# Altium schematic sheet main sch.SchDoc
size A4; SheetNumber: 1; SheetTotal: 4
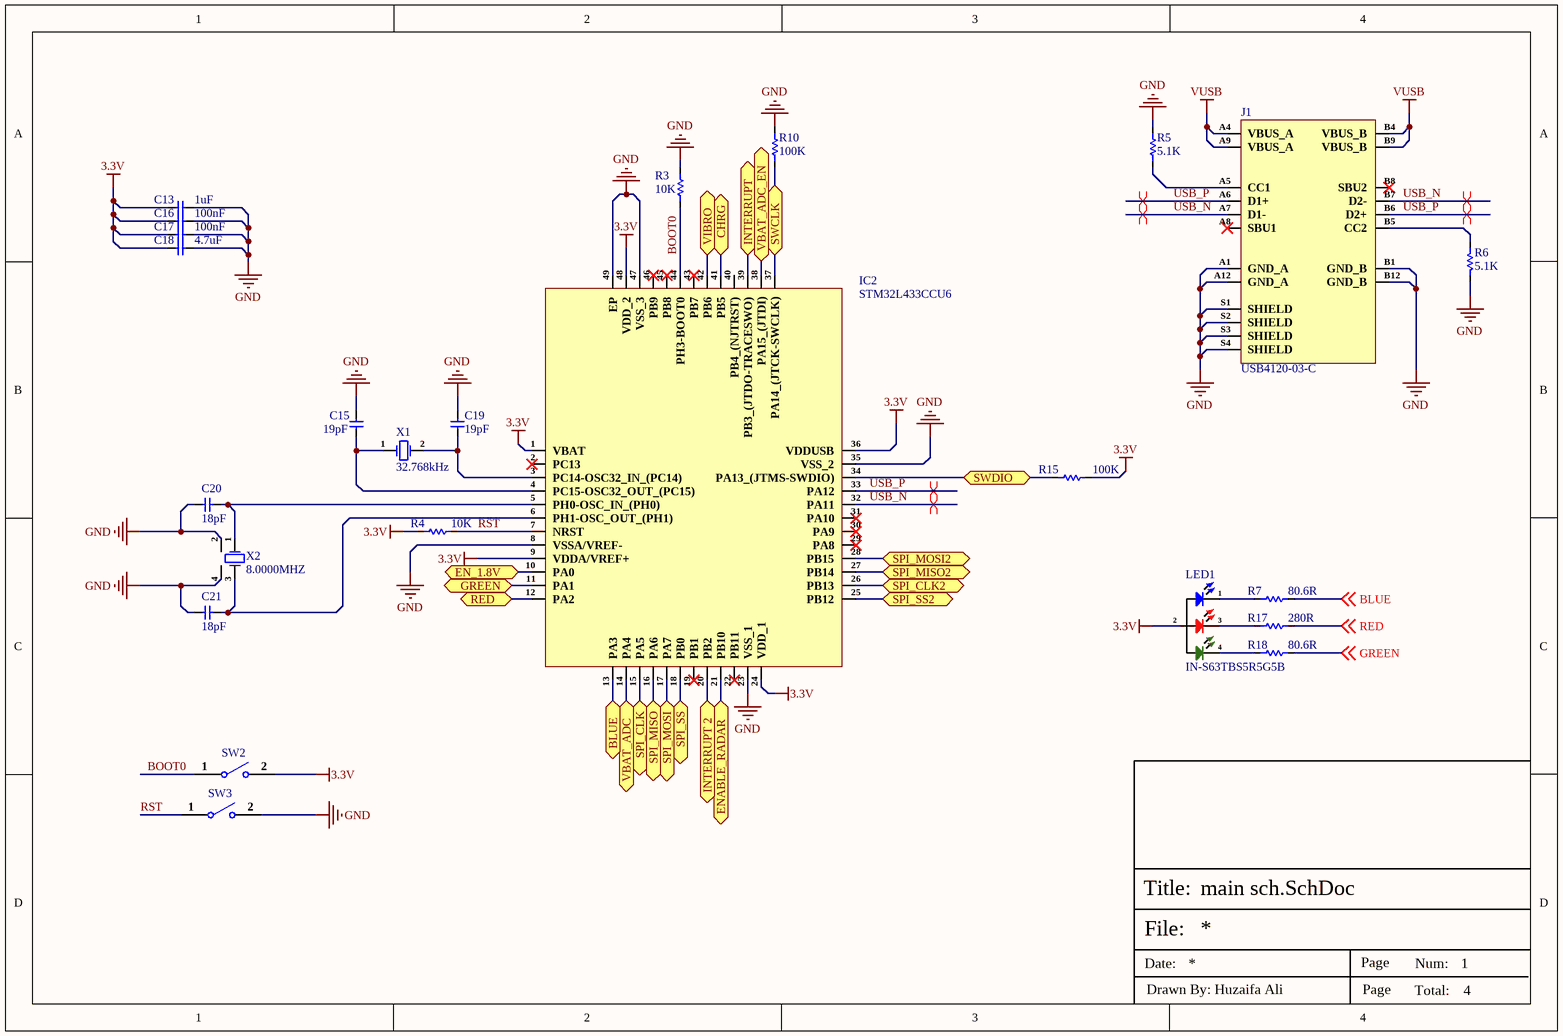
[diagram p0: main sch.SchDoc]

## Parts
C13  1uF  [Cap-0402]
C15  19pF  [Cap-0402]
C16  100nF  [Cap-0402]
C17  100nF  [Cap-0402]
C18  4.7uF  [Cap-0402]
C19  19pF  [Cap-0402]
C20  18pF  [CAP-0201]
C21  18pF  [CAP-0201]
IC2  STM32L433CCU6  [48-UFQFPN(7x7)]
J1  USB4120-03-C  [USB4120-03-C]
LED1  IN-S63TBS5R5G5B  [IN-S63TBS5R5G5B]
R3  10K  [Res-0402]
R4  10K  [Res-0402]
R5  5.1K  [Res-0402]
R6  5.1K  [Res-0402]
R7  80.6R  [Res-0402]
R10  100K  [Res-0402]
R15  100K  [Res-0402]
R17  280R  [Res-0402]
R18  80.6R  [Res-0402]
SW2  B3U-1000P  [B3U-1000P]  (value not drawn)
SW3  B3U-1000P  [B3U-1000P]  (value not drawn)
X1  32.768kHz  [SMD1610-2P]
X2  8.0000MHZ  [SMD3225-4P]

## Ports
BLUE (bidir), CHRG (bidir), EN_1.8V (bidir), ENABLE_RADAR (bidir), GREEN (bidir), INTERRUPT 2 (bidir), INTERRUPT (bidir), RED (bidir), SPI_CLK2 (bidir), SPI_CLK (bidir), SPI_MISO2 (bidir), SPI_MISO (bidir), SPI_MOSI2 (bidir), SPI_MOSI (bidir), SPI_SS2 (bidir), SPI_SS (bidir), SWCLK (bidir), SWDIO (bidir), VBAT_ADC (bidir), VBAT_ADC_EN (bidir), VIBRO (bidir)

## Nets
3.3V: C13.1 C16.1 C17.1 C18.1 IC2.1(VBAT) IC2.9(VDDA/VREF+) IC2.24(VDD_1) IC2.36(VDDUSB) IC2.48(VDD_2) LED1.2(+) R4.1 R15.1 SW2.2
GND: C13.2 C15.2 C16.2 C17.2 C18.2 C19.2 C20.1 C21.1 IC2.8(VSSA/VREF-) IC2.23(VSS_1) IC2.35(VSS_2) IC2.47(VSS_3) IC2.49(EP) J1.A1(GND_A) J1.A12(GND_A) J1.B1(GND_B) J1.B12(GND_B) J1.S1(SHIELD) J1.S2(SHIELD) J1.S3(SHIELD) J1.S4(SHIELD) R3.2 R5.2 R6.1 R10.2 SW3.2 X2.2(GND) X2.4(GND)
VUSB: J1.A4(VBUS_A) J1.A9(VBUS_A) J1.B4(VBUS_B) J1.B9(VBUS_B)
BLUE: IC2.13(PA3) ; port BLUE
BLUE: R7.2 ; off-sheet BLUE  [a separate net that carries the same name]
BOOT0: IC2.44(PH3-BOOT0) R3.1 SW2.1
CHRG: IC2.41(PB5) ; port CHRG
EN_1.8V: IC2.10(PA0) ; port EN_1.8V
ENABLE_RADAR: IC2.21(PB10) ; port ENABLE_RADAR
GREEN: IC2.11(PA1) ; port GREEN
GREEN: R18.2 ; off-sheet GREEN  [a separate net that carries the same name]
INTERRUPT: IC2.39(PB3_(JTDO-TRACESWO)) ; port INTERRUPT
INTERRUPT 2: IC2.20(PB2) ; port INTERRUPT 2
RED: IC2.12(PA2) ; port RED
RED: R17.2 ; off-sheet RED  [a separate net that carries the same name]
RST: IC2.7(NRST) R4.2 SW3.1
SPI_CLK: IC2.15(PA5) ; port SPI_CLK
SPI_CLK2: IC2.26(PB13) ; port SPI_CLK2
SPI_MISO: IC2.16(PA6) ; port SPI_MISO
SPI_MISO2: IC2.27(PB14) ; port SPI_MISO2
SPI_MOSI: IC2.17(PA7) ; port SPI_MOSI
SPI_MOSI2: IC2.28(PB15) ; port SPI_MOSI2
SPI_SS: IC2.18(PB0) ; port SPI_SS
SPI_SS2: IC2.25(PB12) ; port SPI_SS2
SWCLK: IC2.37(PA14_(JTCK-SWCLK)) R10.1 ; port SWCLK
SWDIO: IC2.34(PA13_(JTMS-SWDIO)) R15.2 ; port SWDIO
USB_N: IC2.32(PA11) J1.A7(D1-) J1.B7(D2-)
USB_P: IC2.33(PA12) J1.A6(D1+) J1.B6(D2+)
VBAT_ADC: IC2.14(PA4) ; port VBAT_ADC
VBAT_ADC_EN: IC2.38(PA15_(JTDI)) ; port VBAT_ADC_EN
VIBRO: IC2.42(PB6) ; port VIBRO
NetC15_1: C15.1 IC2.4(PC15-OSC32_OUT_(PC15)) X1.1(OSC1)
NetC19_1: C19.1 IC2.3(PC14-OSC32_IN_(PC14)) X1.2(OSC2)
NetC20_2: C20.2 IC2.5(PH0-OSC_IN_(PH0)) X2.1(IN/OUT)
NetC21_2: C21.2 IC2.6(PH1-OSC_OUT_(PH1)) X2.3(Out/In)
NetJ1_A5: J1.A5(CC1) R5.1
NetJ1_B5: J1.B5(CC2) R6.2
NetLED1_1: LED1.1(-BLUE) R7.1
NetLED1_3: LED1.3(-RED) R17.1
NetLED1_4: LED1.4(-GREEN) R18.1

Not connected (* = marked no-connect by the designer): IC2 2(PC13)* 19(PB1)* 22(PB11)* 29(PA8)* 30(PA9)* 31(PA10)* 40(PB4_(NJTRST)) 43(PB7)* 45(PB8)* 46(PB9)*; J1 A8(SBU1)* B8(SBU2)*

## Layout directives
differential pair; net class USB; differential pair class USB_Lines; rule Impedance Constraint [Min = 88.00    Max = 90.00    ]; rule Matched Net Lengths [Tolerance = 20mil]: USB_N, USB_P

## Notes on the sheet
- File:
- Title:
- Date:
- Page
- Num:
- Total:
- Drawn By: Huzaifa Ali

## Library data of the parts
C13 = CC0402KRX5R7BB105: CAP CER 1UF 16V X5R 0402; Manufacturer: Yageo; Tolerance: 10%; Item Type: Capacitor; Supplier 1: Digi-Key; Manufacturer Part Number: CC0402KRX5R7BB105; Stock 1: 1405667; Pricing 1: 1=0.36, 10=0.252, 100=0.1512, 500=0.1134, 1000=0.09576, 2500=0.09072, 5000=0.08568 (USD); Mount: Surface Mount; Case/Package: 0402; Weight: 2.3E-05oz; Case Code (Imperial): 0402; Case Code (Metric): 1005; Min Operating Temperature: -55°C; Max Operating Temperature: 85°C; Capacitance: 1uF; Dielectric: X5R; Packaging: Tape and Reel; Voltage Rating (DC): 16V; Voltage Rating: 16V; Termination: SMD/SMT; Composition: Ceramic; Length: 1mm; Height: 0.5mm; Width: 0.02inch; Thickness: 0.022inch; Depth: 0.5mm; Radiation Hardening: No; Lead Free: Lead Free; Halogen Free: Halogen Free; ComponentLink1URL: http://www.yageo.com/documents/recent/UPY-GPHC_X5R_4V-to-50V_12.pdf?src-supplier=Avnet+Europe; ComponentLink1Description: http://www.yageo.com/documents/recent/UPY-GPHC_X5R_4V-to-50V_12.pdf?src-supplier=Avnet+Europe; Supplier Part Number 1: 311-1691-6-ND; LCSC Part Number: C325464
C15 C19 = GJM1555C1H190GB01D: CAP CER 19PF 50V C0G/NP0 0402; Manufacturer: Murata; Item Type: Ceramic Capacitors; Supplier: Mouser; Supplier Part Number: 81-GJM1555C1H190GB1D; Manufacturer Part Number: GJM1555C1H190GB01D; RoHS: Yes; Stock: 2045; Pricing: 1=0.13, 10=0.082, 50=0.082, 100=0.042, 1000=0.027, 10000=0.02 (USD)
C16 C17 = CC0402KRX5R7BB104: CAP CER 0.1UF 16V X5R 0402; Manufacturer: Yageo; Tolerance: 10%; Supplier 1: Mouser; Manufacturer Part Number: CC0402KRX5R7BB104; RoHS: Yes; Category: Ceramic Capacitors; Stock 1: 936792; Pricing 1: 1=0.10000, 10=0.02300, 50=0.02300, 100=0.01100, 1000=0.00600, 10000=0.00400 (USD); Mount: Surface Mount; Case/Package: 0402; Number of Pins: 2; Case Code (Metric): 1005; Case Code (Imperial): 0402; Min Operating Temperature: -55°C; Max Operating Temperature: 85°C; Capacitance: 100nF; Dielectric: X5R; Packaging: Tape and Reel; Voltage Rating: 16V; Package Quantity: 1; Voltage Rating (DC): 16V; Termination: SMD/SMT; Resistor Type: Ceramic; Series: CC; Construction: Flat; Length: 1mm; Width: 0.02inch; Height: 0.5mm; Thickness: 0.022inch; Depth: 0.5mm; Radiation Hardening: No; REACH SVHC: Unknown; Lead Free: Lead Free; Halogen Free: Halogen Free; RoHS Compliant: Yes; ComponentLink1URL: https://datasheet.ciiva.com/155/mlccorderingcode-155879.pdf?src-supplier=Digi-Key; ComponentLink1Description: https://datasheet.ciiva.com/155/mlccorderingcode-155879.pdf?src-supplier=Digi-Key; ComponentLink2URL: https://datasheet.ciiva.com/155/mlccorderingcode-155878.pdf?src-supplier=Digi-Key; ComponentLink2Description: https://datasheet.ciiva.com/155/mlccorderingcode-155878.pdf?src-supplier=Digi-Key; ComponentLink3URL: https://datasheet.ciiva.com/155/mlccorderingcode-155880.pdf?src-supplier=Digi-Key; ComponentLink3Description: https://datasheet.ciiva.com/155/mlccorderingcode-155880.pdf?src-supplier=Digi-Key; ComponentLink4URL: https://datasheet.ciiva.com/11464/upy-gphc-x5r-4v-to-50v-12-11464869.pdf?src-supplier=Avnet; ComponentLink4Description: https://datasheet.ciiva.com/11464/upy-gphc-x5r-4v-to-50v-12-11464869.pdf?src-supplier=Avnet; Supplier Part Number 1: 603-CC402KRX5R7BB104; LCSC Part Number: C106204
C18 = CC0402KRX5R6BB475: CAP CER 4.7UF 10V X5R 0402; Manufacturer: Yageo; Tolerance: 10%; Supplier 1: Farnell; Manufacturer Part Number: CC0402KRX5R6BB475; RoHS: Yes; Category: Ceramic Capacitors; Stock 1: 20000; Pricing 1: 10000=0.02310, 50000=0.02100 (GBP); Mount: Surface Mount; Case/Package: 0402; Case Code (Imperial): 0402; Case Code (Metric): 1005; Min Operating Temperature: -55°C; Max Operating Temperature: 85°C; Packaging: Cut Tape; Capacitance: 4.7uF; Voltage Rating: 10V; RoHS Compliant: Yes; ComponentLink1URL: http://www.yageo.com/documents/recent/UPY-GPHC_X5R_4V-to-50V_25.pdf?src-supplier=Digi-Key; ComponentLink1Description: http://www.yageo.com/documents/recent/UPY-GPHC_X5R_4V-to-50V_25.pdf?src-supplier=Digi-Key; Supplier Part Number 1: 3871698; LCSC Part Number: C326586
C20 C21 = GJM0335C1E180GB01D: CAP CER 18PF 25V C0G/NP0 0201; Manufacturer: Murata Electronics; Item Type: Capacitor; Manufacturer Part Number: GJM0335C1E180GB01D; Package: 0201; LCSC Part Number: C913481; ComponentLink1Description: LCSC; Supplier: Rs; Supplier Part Number: 1853317; RoHS: Yes; Category: Ceramic Capacitors; Stock: 15000; Pricing: 1000=0.018, 5000=0.015, 10000=0.012 (GBP); ComponentLink2URL: http://www.mouser.com/ds/2/281/c02e-2905.pdf?src-supplier=Mouser; ComponentLink2Description: http://www.mouser.com/ds/2/281/c02e-2905.pdf?src-supplier=Mouser; ComponentLink3URL: https://datasheet.octopart.com/GJM0335C1E180GB01D-Murata-datasheet-22122223.pdf?src-supplier=Future+Electronics; ComponentLink3Description: https://datasheet.octopart.com/GJM0335C1E180GB01D-Murata-datasheet-22122223.pdf?src-supplier=Future+Electronics; ComponentLink4URL: https://search.murata.co.jp/Ceramy/image/img/A01X/G101/ENG/GJM0335C1E180GB01-01.pdf?src-supplier=Digi-Key; ComponentLink4Description: https://search.murata.co.jp/Ceramy/image/img/A01X/G101/ENG/GJM0335C1E180GB01-01.pdf?src-supplier=Digi-Key; ComponentLink5URL: http://search.murata.co.jp/Ceramy/image/img/A01X/G101/ENG/GJM0335C1E180GB01-01.pdf?src-supplier=Digi-Key; ComponentLink5Description: http://search.murata.co.jp/Ceramy/image/img/A01X/G101/ENG/GJM0335C1E180GB01-01.pdf?src-supplier=Digi-Key; ComponentLink6URL: https://datasheet.octopart.com/GJM0335C1E180GB01D-Murata-datasheet-12511495.pdf?src-supplier=TME; ComponentLink6Description: https://datasheet.octopart.com/GJM0335C1E180GB01D-Murata-datasheet-12511495.pdf?src-supplier=TME
IC2 = STM32L433CCU6: IC MCU 32BIT 256KB FLSH 48UFQFPN; Manufacturer: STMicroelectronics; Datasheet Link: http://www.st.com/content/ccc/resource/technical/document/datasheet/f7/a0/fc/27/24/4e/4f/3f/DM00257192.pdf/files/DM00257192.pdf/jcr:content/translations/en.DM00257192.pdf; Height: 0.6mm; Manufacturer Part Number: STM32L433CCU6; Mouser Part Number: 511-STM32L433CCU6; Mouser Price/Stock: https://www.mouser.co.uk/ProductDetail/STMicroelectronics/STM32L433CCU6?qs=dTJS0cRn7oiKq9T6SJeUpg%3D%3D; Arrow Part Number: STM32L433CCU6; Arrow Price/Stock: https://www.arrow.com/en/products/stm32l433ccu6/stmicroelectronics?region=nac; LCSC Part Number: C1341450; Item Type: IC
J1 = USB4120-03-C: CONN RCPT USB2.0 TYP C 24POS SMD; Manufacturer: Global Connector Technology; Item Type: Connector; Supplier: Future Electronics; Supplier Part Number: 2142143; Manufacturer Part Number: USB4120-03-C; RoHS: No; Category: Connectors; Stock: 600; Pricing: 600=0.545, 1200=0.53, 1800=0.525, 2400=0.52, 3000=0.5 (USD); ComponentLink1URL: https://datasheet.octopart.com/USB4120-03-C-Global-Connector-Technology-datasheet-169246750.pdf?src-supplier=Future+Electronics; ComponentLink1Description: https://datasheet.octopart.com/USB4120-03-C-Global-Connector-Technology-datasheet-169246750.pdf?src-supplier=Future+Electronics; ComponentLink2URL: https://datasheet.octopart.com/USB4120-03-C-GCT-datasheet-166929325.pdf?src-supplier=TME; ComponentLink2Description: https://datasheet.octopart.com/USB4120-03-C-GCT-datasheet-166929325.pdf?src-supplier=TME
LED1 = IN-S63TBS5R5G5B: LED RGB CLEAR 0603 SMD R/A; Manufacturer: Inolux; Supplier: Mouser; Supplier Part Number: 743-IN-S63TBS5R5G5B; Manufacturer Part Number: IN-S63TBS5R5G5B; RoHS: No; Category: LEDs; Stock: 12751; Pricing: 1=0.5, 10=0.328, 50=0.328, 100=0.218, 1000=0.152, 10000=0.141 (USD); Item Type: LED
R3 R4 = RC0402FR-0710KL: RES 10K OHM 1% 1/16W 0402; Manufacturer: Yageo; Resistance: 10kR; Voltage Rating (DC): 50V; Temperature Coefficient: 100ppm/°C; Power Rating: 62.5mW; Max Power Dissipation: 63mW; Item Type: Resistor; Supplier 1: Mouser; Manufacturer Part Number: RC0402FR-0710KL; RoHS: Yes; Category: Chip SMD Resistors; Stock 1: 18648329; Pricing 1: 1=0.10000, 10=0.01400, 50=0.01400, 100=0.00500, 1000=0.00300, 10000=0.00200 (USD); Case/Package: 0402; Number of Pins: 2; Case Code (Imperial): 0402; Case Code (Metric): 1005; Min Operating Temperature: -55°C; Max Operating Temperature: 155°C; Resistor Type: Thick Film; Tolerance: 1%; Packaging: Tape and Reel; Voltage Rating: 50V; Termination: SMD/SMT; Working Voltage: 50V; Number of Terminations: 2; Features: Moisture Resistant; Series: RC; Resistance Tolerance: 1%; Construction: Rectangular; Length: 1mm; Width: 0.5mm; Height: 0.32mm; Depth: 0.5mm; Lead Pitch: 0.2mm; REACH SVHC: No SVHC; Lead Free: Lead Free; RoHS Compliant: Yes; Military Standard: Not; ComponentLink1URL: https://datasheet.ciiva.com/7660/38568-7660787.pdf?src-supplier=Element14; ComponentLink1Description: https://datasheet.ciiva.com/7660/38568-7660787.pdf?src-supplier=Element14; ComponentLink2URL: https://datasheet.ciiva.com/7849/1686128-7849814.pdf?src-supplier=Element14; ComponentLink2Description: https://datasheet.ciiva.com/7849/1686128-7849814.pdf?src-supplier=Element14; ComponentLink3URL: https://datasheet.ciiva.com/7983/1018594-7983486.pdf?src-supplier=Element14; ComponentLink3Description: https://datasheet.ciiva.com/7983/1018594-7983486.pdf?src-supplier=Element14; ComponentLink4URL: https://datasheet.ciiva.com/22747/1018594-22747512.pdf?src-supplier=Element14; ComponentLink4Description: https://datasheet.ciiva.com/22747/1018594-22747512.pdf?src-supplier=Element14; ComponentLink5URL: https://datasheet.ciiva.com/12667/pyu-rc0402-51-rohs-l-6-r-12667067.pdf?src-supplier=Mouser; ComponentLink5Description: https://datasheet.ciiva.com/12667/pyu-rc0402-51-rohs-l-6-r-12667067.pdf?src-supplier=Mouser; ComponentLink6URL: https://datasheet.ciiva.com/7849/1784430-7849813.pdf?src-supplier=Element14; ComponentLink6Description: https://datasheet.ciiva.com/7849/1784430-7849813.pdf?src-supplier=Element14; ComponentLink7URL: https://datasheet.ciiva.com/7849/1784430-7849815.pdf?src-supplier=Element14; ComponentLink7Description: https://datasheet.ciiva.com/7849/1784430-7849815.pdf?src-supplier=Element14; Supplier Part Number 1: 603-RC0402FR-0710KL; LCSC Part Number: C60490
R5 R6 = RC0402FR-075K1L: RES 5.1K OHM 1% 1/16W 0402; Manufacturer: Yageo; Power Rating: 63mW; Resistance: 5.1kR; Temperature Coefficient: 100ppm/°C; Voltage Rating: 50V; Item Type: Resistor; Supplier 1: Avnet; Manufacturer Part Number: RC0402FR-075K1L; RoHS: Yes; Category: Chip SMD Resistors; Stock 1: 65000; Pricing 1: 10000=0.00085 (USD); Case/Package: 0402; Case Code (Metric): 1005; Case Code (Imperial): 0402; Min Operating Temperature: -55°C; Max Operating Temperature: 155°C; Tolerance: 1%; Technology: THICK FILM; Packaging: Tape and Reel; Package Quantity: 1; Resistor Type: Thick Film; Number of Terminations: 2; Termination: SMD/SMT; Max Power Dissipation: 63mW; Voltage Rating (DC): 50V; Working Voltage: 50V; Features: Moisture Resistant; Series: RC; Resistance Tolerance: 1%; Construction: Rectangular; Length: 1mm; Width: 0.02inch; Height: 0.016inch; Depth: 0.5mm; RoHS Compliant: Yes; Military Standard: Not; Lead Free: Lead Free; ComponentLink1URL: https://datasheet.ciiva.com/7983/1018594-7983519.pdf?src-supplier=Element14; ComponentLink1Description: https://datasheet.ciiva.com/7983/1018594-7983519.pdf?src-supplier=Element14; ComponentLink2URL: https://datasheet.ciiva.com/46394/1018594-46394936.pdf?src-supplier=Element14; ComponentLink2Description: https://datasheet.ciiva.com/46394/1018594-46394936.pdf?src-supplier=Element14; ComponentLink3URL: https://datasheet.ciiva.com/2453/pyu-r-int-thick-7-2453401.pdf?src-supplier=Digi-Key; ComponentLink3Description: https://datasheet.ciiva.com/2453/pyu-r-int-thick-7-2453401.pdf?src-supplier=Digi-Key; ComponentLink4URL: https://datasheet.ciiva.com/2453/pyu-r-int-thick-7-2453402.pdf?src-supplier=Digi-Key; ComponentLink4Description: https://datasheet.ciiva.com/2453/pyu-r-int-thick-7-2453402.pdf?src-supplier=Digi-Key; ComponentLink5URL: https://datasheet.ciiva.com/2453/pyu-r-int-thick-7-2453400.pdf?src-supplier=Digi-Key; ComponentLink5Description: https://datasheet.ciiva.com/2453/pyu-r-int-thick-7-2453400.pdf?src-supplier=Digi-Key; ComponentLink6URL: https://datasheet.ciiva.com/12558/pyu-rc0402-51-rohs-l-6-r-8721-12558460.pdf?src-supplier=Mouser; ComponentLink6Description: https://datasheet.ciiva.com/12558/pyu-rc0402-51-rohs-l-6-r-8721-12558460.pdf?src-supplier=Mouser; ComponentLink7URL: https://datasheet.ciiva.com/16744/pyu-rc0402-51-rohs-l-6-r-16744283.pdf?src-supplier=Future+Electronics; ComponentLink7Description: https://datasheet.ciiva.com/16744/pyu-rc0402-51-rohs-l-6-r-16744283.pdf?src-supplier=Future+Electronics; ComponentLink8URL: https://datasheet.ciiva.com/15189/getdatasheetpartid-323636-15189493.pdf?src-supplier=Verical; ComponentLink8Description: https://datasheet.ciiva.com/15189/getdatasheetpartid-323636-15189493.pdf?src-supplier=Verical; Supplier Part Number 1: RC0402FR-075K1L; LCSC Part Number: C105872
R7 R18 = RN73H1ETTP80R6F50: Res 80.6 Ohm 1% 1/16W 0402; Manufacturer: KOA Speer; Item Type: Resistor; Power Rating: 63mW; Voltage Rating: 50V; Temperature Coefficient: 50ppm/°C; Supplier: Digikey; Supplier Part Number: 2019-RN73H1ETTP80R6F50CT-ND; Manufacturer Part Number: RN73H1ETTP80R6F50; RoHS: Yes; Pricing: 1000=0.08675 (USD); Case/Package: 0402; Case Code (Imperial): 0402; Case Code (Metric): 1005; Weight: 2.3E-05oz; Min Operating Temperature: -55°C; Max Operating Temperature: 155°C; Value: 80.6R; Packaging: Tape and Reel; Tolerance: 1%; Termination: SMD/SMT; Voltage Rating (DC): 50V; Series: RN73H; Length: 1mm; Width: 0.5mm; Height: 0.35mm; RoHS Compliant: Yes; ComponentLink1URL: http://www.mouser.com/ds/2/219/RN73H-12200.pdf?src-supplier=Mouser; ComponentLink1Description: http://www.mouser.com/ds/2/219/RN73H-12200.pdf?src-supplier=Mouser
R10 R15 = RC0402FR-07100KL: RES 100K OHM 1% 1/16W 0402; Manufacturer: Yageo; Resistance: 100kR; Temperature Coefficient: 100ppm/°C; Power Rating: 63mW; Voltage Rating: 50V; Item Type: Resistor; Supplier 1: Mouser; Manufacturer Part Number: RC0402FR-07100KL; RoHS: Yes; Category: Chip SMD Resistors; Stock 1: 7759549; Pricing 1: 1=0.10000, 10=0.01200, 50=0.01200, 100=0.00500, 1000=0.00300, 2500=0.00200, 10000=0.00100 (USD); Case/Package: 0402; Case Code (Metric): 1005; Case Code (Imperial): 0402; Min Operating Temperature: -55°C; Max Operating Temperature: 155°C; Resistor Type: Thick Film; Tolerance: 1%; Packaging: Tape and Reel; Package Quantity: 1; Number of Terminations: 2; Termination: SMD/SMT; Max Power Dissipation: 63mW; Working Voltage: 50V; Features: Moisture Resistant; Series: RC; Resistance Tolerance: 1%; Construction: Rectangular; Technology: THICK FILM; Length: 0.039inch; Width: 0.02inch; Height: 0.016inch; Depth: 0.5mm; REACH SVHC: No SVHC; Lead Free: Lead Free; RoHS Compliant: Yes; Military Standard: Not; ComponentLink1URL: https://datasheet.ciiva.com/11819/0900766b80c66297-11819452.pdf?src-supplier=RSComponents; ComponentLink1Description: https://datasheet.ciiva.com/11819/0900766b80c66297-11819452.pdf?src-supplier=RSComponents; ComponentLink2URL: https://datasheet.ciiva.com/22747/1018594-22747509.pdf?src-supplier=Element14; ComponentLink2Description: https://datasheet.ciiva.com/22747/1018594-22747509.pdf?src-supplier=Element14; ComponentLink3URL: https://datasheet.ciiva.com/2453/pyu-r-int-thick-7-2453362.pdf?src-supplier=Digi-Key; ComponentLink3Description: https://datasheet.ciiva.com/2453/pyu-r-int-thick-7-2453362.pdf?src-supplier=Digi-Key; ComponentLink4URL: https://datasheet.ciiva.com/2453/pyu-r-int-thick-7-2453363.pdf?src-supplier=Digi-Key; ComponentLink4Description: https://datasheet.ciiva.com/2453/pyu-r-int-thick-7-2453363.pdf?src-supplier=Digi-Key; ComponentLink5URL: https://datasheet.ciiva.com/2453/pyu-r-int-thick-7-2453361.pdf?src-supplier=Digi-Key; ComponentLink5Description: https://datasheet.ciiva.com/2453/pyu-r-int-thick-7-2453361.pdf?src-supplier=Digi-Key; ComponentLink6URL: https://datasheet.ciiva.com/12667/pyu-rc0402-51-rohs-l-6-r-12667930.pdf?src-supplier=Mouser; ComponentLink6Description: https://datasheet.ciiva.com/12667/pyu-rc0402-51-rohs-l-6-r-12667930.pdf?src-supplier=Mouser; ComponentLink7URL: https://datasheet.ciiva.com/15189/getdatasheetpartid-323696-15189334.pdf?src-supplier=Verical; ComponentLink7Description: https://datasheet.ciiva.com/15189/getdatasheetpartid-323696-15189334.pdf?src-supplier=Verical; Supplier Part Number 1: 603-RC0402FR-07100KL; LCSC Part Number: C60491
R17 = RN73H1ETTP2800D50: RES 280 OHM 0.5% 1/16W 0402; Manufacturer: KOA Speer; Item Type: Resistor; Power Rating: 63mW; Voltage Rating: 50V; Temperature Coefficient: 50ppm/°C; Supplier: Digikey; Supplier Part Number: 2019-RN73H1ETTP2800D50CT-ND; Manufacturer Part Number: RN73H1ETTP2800D50; RoHS: Yes; Pricing: 1000=0.08675 (USD); Case/Package: 0402; Case Code (Imperial): 0402; Case Code (Metric): 1005; Min Operating Temperature: -55°C; Max Operating Temperature: 155°C; Value: 280R; Packaging: Tape and Reel; Tolerance: 0.5%; Termination: SMD/SMT; Voltage Rating (DC): 50V; Series: RN73H; Length: 1mm; Width: 0.5mm; Height: 0.35mm; RoHS Compliant: Yes; ComponentLink1URL: http://www.koaspeer.com/catimages/Products/RN73H/RN73H.pdf?src-supplier=Mouser; ComponentLink1Description: http://www.koaspeer.com/catimages/Products/RN73H/RN73H.pdf?src-supplier=Mouser
SW2 SW3 = B3U-1000P: SWITCH TACTILE SPST-NO 0.05A 12V; Manufacturer: Omron; Mechanical Life: 200000Cycles; Operating Force: 1.5N; Throw Configuration: SPST; Current Rating: 50mA; Contact Resistance: 100mR; Illumination Type: Non-Illuminated,Illuminated; Switch Travel: 0.15mm; Switch Function: Off-Mom; Actuator Type: Standard; Actuator Length: 0.4mm; Ratings: Dust Proof,IP40; ComponentLink1URL: http://www.farnell.com/datasheets/60838.pdf?src-supplier=Farnell; ComponentLink1Description: http://www.farnell.com/datasheets/60838.pdf?src-supplier=Farnell; ComponentLink2URL: http://www.farnell.com/datasheets/60838.pdf?src-supplier=Element14; ComponentLink2Description: http://www.farnell.com/datasheets/60838.pdf?src-supplier=Element14; ComponentLink3URL: https://omronfs.omron.com/en_US/ecb/products/pdf/en-b3u.pdf?src-supplier=Digi-Key; ComponentLink3Description: https://omronfs.omron.com/en_US/ecb/products/pdf/en-b3u.pdf?src-supplier=Digi-Key; ComponentLink4URL: http://www.omron.com/ecb/products/pdf/en-b3u.pdf?src-supplier=Digi-Key; ComponentLink4Description: http://www.omron.com/ecb/products/pdf/en-b3u.pdf?src-supplier=Digi-Key; ComponentLink5URL: https://www.distrelec.biz/Web/Downloads/he/et/B3U_eng_datasheet.pdf?mime=application%2Fpdf&src-supplier=Distrelec; ComponentLink5Description: https://www.distrelec.biz/Web/Downloads/he/et/B3U_eng_datasheet.pdf?mime=application%2Fpdf&src-supplier=Distrelec; ComponentLink6URL: http://www.onlinecomponents.com/productFiles/mf-OM/en-b3u.pdf?src-supplier=Onlinecomponents.com; ComponentLink6Description: http://www.onlinecomponents.com/productFiles/mf-OM/en-b3u.pdf?src-supplier=Onlinecomponents.com; Supplier 1: Digi-Key; Manufacturer Part Number: B3U-1000P; Stock 1: 116454; Pricing 1: 1=1, 10=0.961, 25=0.9064, 50=0.7976, 100=0.7251, 250=0.68888, 500=0.67074, 1000=0.52571 (USD); Mount: Surface Mount; Weight: 0.000776oz; Contact Material: Silver; Min Operating Temperature: -25°C; Max Operating Temperature: 70°C; Packaging: Tape and Reel; Voltage Rating (DC): 12V; Package Quantity: 1; Max Current Rating: 50mA; Termination: SMD/SMT; Orientation: Straight; Max Voltage Rating (DC): 12V; Electrical Life: 200000Cycles; Insulation Resistance: 100MR; Contact Current Rating: 50mA; Length: 4mm; Height: 1.2mm; Depth: 2.5mm; Width: 3mm; REACH SVHC: Unknown; Lead Free: Lead Free; ComponentLink7URL: https://www.verical.com/server-webapp/html/getDatasheet?partID=552554&src-supplier=Verical; ComponentLink7Description: https://www.verical.com/server-webapp/html/getDatasheet?partID=552554&src-supplier=Verical; ComponentLink8URL: http://www.farnell.com/datasheets/1685550.pdf?src-supplier=Element14; ComponentLink8Description: http://www.farnell.com/datasheets/1685550.pdf?src-supplier=Element14; ComponentLink9URL: http://www.farnell.com/datasheets/2610940.pdf?src-supplier=Farnell; ComponentLink9Description: http://www.farnell.com/datasheets/2610940.pdf?src-supplier=Farnell; ComponentLink10URL: https://www.alliedelec.com/m/d/4c8a9ef82804fc3c241a13c1e298fd73.pdf?src-supplier=Allied+Electronics; ComponentLink10Description: https://www.alliedelec.com/m/d/4c8a9ef82804fc3c241a13c1e298fd73.pdf?src-supplier=Allied+Electronics; Supplier Part Number 1: SW1020DKR-ND; LCSC Part Number: C231329; Item Type: Switch
X1 = ECS-.327-12.5-16-TR: CRYSTAL 32.7680KHZ 12.5PF SMD; Manufacturer: ECS International; Supplier: Avnet; Supplier Part Number: ECS-.327-12.5-16-TR; Manufacturer Part Number: ECS-.327-12.5-16-TR; RoHS: Yes; Category: Crystals; Stock: 20000; Pricing: 5000=0.403 (USD); ComponentLink1URL: https://datasheet.octopart.com/ECS-.327-12.5-16-TR-ECS-International-datasheet-14433430.pdf?src-supplier=Future+Electronics; ComponentLink1Description: https://datasheet.octopart.com/ECS-.327-12.5-16-TR-ECS-International-datasheet-14433430.pdf?src-supplier=Future+Electronics; ComponentLink2URL: http://www.ecsxtal.com/store/pdf/ECX-16.pdf?src-supplier=Digikey; ComponentLink2Description: http://www.ecsxtal.com/store/pdf/ECX-16.pdf?src-supplier=Digikey; ComponentLink3URL: http://www.ecsxtal.com/store/pdf/partnumber4.pdf?src-supplier=Digikey; ComponentLink3Description: http://www.ecsxtal.com/store/pdf/partnumber4.pdf?src-supplier=Digikey; ComponentLink4URL: https://datasheet.octopart.com/ECS-.327-12.5-16-TR-ECS-International-datasheet-130008819.pdf?src-supplier=Master+Electronics; ComponentLink4Description: https://datasheet.octopart.com/ECS-.327-12.5-16-TR-ECS-International-datasheet-130008819.pdf?src-supplier=Master+Electronics; Item Type: Crystal
X2 = ECS-80-12-33-JGN-TR: CRYSTAL 8.0000MHZ 12PF SMD; Manufacturer: ECS International; Supplier: Avnet; Supplier Part Number: ECS-80-12-33-JGN-TR; Manufacturer Part Number: ECS-80-12-33-JGN-TR; RoHS: No; Stock: 58000; Pricing: 1000=0.27283 (USD); RoHS Compliant: Yes; ComponentLink1URL: https://datasheet.octopart.com/ECS-80-12-33-JGN-TR-ECS-International-datasheet-140089731.pdf?src-supplier=Future+Electronics; ComponentLink1Description: https://datasheet.octopart.com/ECS-80-12-33-JGN-TR-ECS-International-datasheet-140089731.pdf?src-supplier=Future+Electronics; ComponentLink2URL: https://datasheet.octopart.com/ECS-80-12-33-JGN-TR-ECS-International-datasheet-17018741.pdf?src-supplier=Master+Electronics; ComponentLink2Description: https://datasheet.octopart.com/ECS-80-12-33-JGN-TR-ECS-International-datasheet-17018741.pdf?src-supplier=Master+Electronics; Item Type: Crystal